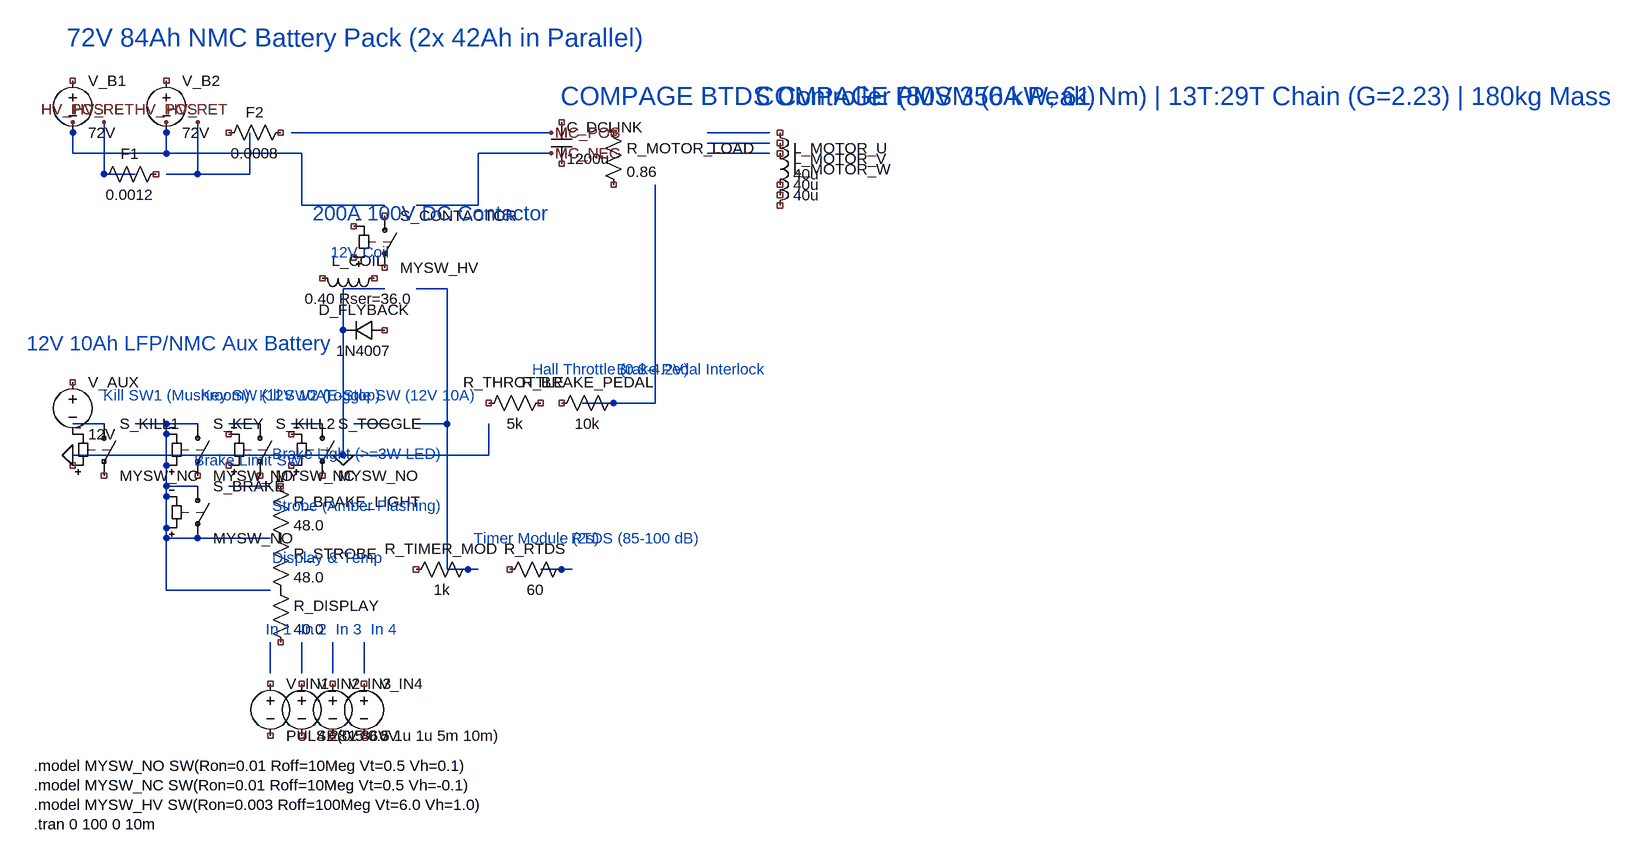
[diagram p0: schematic ev_powertrain.asc]
ev_powertrain.asc, the LTspice schematic file:
Version 4
SHEET 1 2000 1300
WIRE 160 160 160 208
WIRE 160 208 304 208
WIRE 304 208 304 160
WIRE 304 208 512 208
WIRE 208 160 208 240
WIRE 208 240 256 240
WIRE 304 240 352 240
WIRE 352 240 352 160
WIRE 352 240 432 240
WIRE 432 240 432 176
WIRE 496 176 688 176
WIRE 512 208 512 288
WIRE 512 288 640 288
WIRE 688 288 784 288
WIRE 784 288 784 208
WIRE 688 176 896 176
WIRE 784 208 896 208
WIRE 1136 176 1232 176
WIRE 1136 192 1232 192
WIRE 1136 208 1232 208
WIRE 160 624 208 624
WIRE 256 624 304 624
WIRE 304 624 304 720
WIRE 304 624 352 624
WIRE 400 624 448 624
WIRE 496 624 544 624
WIRE 592 624 640 624
WIRE 688 624 736 624
WIRE 736 624 736 416
WIRE 736 416 688 416
WIRE 640 416 576 416
WIRE 576 416 576 672
WIRE 576 672 800 672
WIRE 800 672 800 624
WIRE 160 672 576 672
WIRE 304 720 352 720
WIRE 400 720 464 720
WIRE 304 720 304 800
WIRE 304 800 464 800
WIRE 304 800 304 880
WIRE 304 880 464 880
WIRE 464 960 464 1008
WIRE 512 960 512 1008
WIRE 560 960 560 1008
WIRE 608 960 608 1008
WIRE 736 624 736 848
WIRE 736 848 784 848
WIRE 880 848 928 848
WIRE 1008 592 1056 592
WIRE 1056 592 1056 256
WIRE 944 592 1008 592
FLAG 160 672 0
FLAG 576 672 0
FLAG 208 160 HV_RET
FLAG 352 160 HV_RET
FLAG 896 208 MC_NEG
FLAG 896 176 MC_POS
FLAG 160 160 HV_POS
FLAG 304 160 HV_POS
SYMBOL voltage 160 80 R0
WINDOW 123 0 0 Left 0
WINDOW 39 0 0 Left 0
SYMATTR InstName V_B1
SYMATTR Value 72V
SYMATTR Description 72V 42Ah 3C NMC Pack 1
SYMBOL voltage 304 80 R0
WINDOW 123 0 0 Left 0
WINDOW 39 0 0 Left 0
SYMATTR InstName V_B2
SYMATTR Value 72V
SYMATTR Description 72V 42Ah 3C NMC Pack 2
SYMBOL res 304 224 R90
WINDOW 0 0 56 VBottom 2
WINDOW 3 32 56 VTop 2
SYMATTR InstName F1
SYMATTR Value 0.0012
SYMATTR Description 90A 100V ANL Fuse F1
SYMBOL res 496 160 R90
WINDOW 0 0 56 VBottom 2
WINDOW 3 32 56 VTop 2
SYMATTR InstName F2
SYMATTR Value 0.0008
SYMATTR Description 150A 100V ANL Main Fuse F2
SYMBOL sw 640 288 R0
SYMATTR InstName S_CONTACTOR
SYMATTR Value MYSW_HV
SYMATTR Description 200A 100V DC Contactor Contacts
SYMBOL ind 640 384 R90
WINDOW 0 5 40 VBottom 2
WINDOW 3 32 40 VTop 2
SYMATTR InstName L_COIL
SYMATTR Value 0.40 Rser=36.0
SYMATTR Description 12V Contactor Coil (36 Ohm)
SYMBOL diode 640 464 R90
WINDOW 0 0 32 VBottom 2
WINDOW 3 32 32 VTop 2
SYMATTR InstName D_FLYBACK
SYMATTR Value 1N4007
SYMATTR Description Flyback Protection Diode
SYMBOL voltage 160 544 R0
WINDOW 123 0 0 Left 0
WINDOW 39 0 0 Left 0
SYMATTR InstName V_AUX
SYMATTR Value 12V
SYMATTR Description 12V 10Ah LFP/NMC Auxiliary Battery
SYMBOL sw 208 608 R0
SYMATTR InstName S_KILL1
SYMATTR Value MYSW_NC
SYMATTR Description Kill SW1 (Cockpit Mushroom E-Stop 22.5mm)
SYMBOL sw 352 608 R0
SYMATTR InstName S_KEY
SYMATTR Value MYSW_NO
SYMATTR Description Key SW (Metal Body 12V 10A)
SYMBOL sw 448 608 R0
SYMATTR InstName S_KILL2
SYMATTR Value MYSW_NC
SYMATTR Description Kill SW2 (Push-Pull E-Stop 22mm)
SYMBOL sw 544 608 R0
SYMATTR InstName S_TOGGLE
SYMATTR Value MYSW_NO
SYMATTR Description Toggle SW (12V 10A DPST Covered)
SYMBOL sw 352 704 R0
SYMATTR InstName S_BRAKE
SYMATTR Value MYSW_NO
SYMATTR Description Brake Over-Travel Switch (NC Limit SW 12V 5A)
SYMBOL res 464 704 R0
SYMATTR InstName R_BRAKE_LIGHT
SYMATTR Value 48.0
SYMATTR Description >=3W Red LED Brake Lamp (IP65)
SYMBOL res 464 784 R0
SYMATTR InstName R_STROBE
SYMATTR Value 48.0
SYMATTR Description >=3W Amber Flashing Strobe (IP65)
SYMBOL res 464 864 R0
SYMATTR InstName R_DISPLAY
SYMATTR Value 40.0
SYMATTR Description Digital Dash & Temp Readout (20-150C)
SYMBOL voltage 464 1008 R0
WINDOW 123 0 0 Left 0
WINDOW 39 0 0 Left 0
SYMATTR InstName V_IN1
SYMATTR Value PULSE(0 5 0.5 1u 1u 5m 10m)
SYMATTR Description In 1: Speed Pulse
SYMBOL voltage 512 1008 R0
WINDOW 123 0 0 Left 0
WINDOW 39 0 0 Left 0
SYMATTR InstName V_IN2
SYMATTR Value 4.28V
SYMATTR Description In 2: 72V Battery (84V Scaled)
SYMBOL voltage 560 1008 R0
WINDOW 123 0 0 Left 0
WINDOW 39 0 0 Left 0
SYMATTR InstName V_IN3
SYMATTR Value 1.86V
SYMATTR Description In 3: Motor Temp Sensor
SYMBOL voltage 608 1008 R0
WINDOW 123 0 0 Left 0
WINDOW 39 0 0 Left 0
SYMATTR InstName V_IN4
SYMATTR Value 0V
SYMATTR Description In 4: E-Stop Fault Flag
SYMBOL res 784 832 R90
WINDOW 0 0 56 VBottom 2
WINDOW 3 32 56 VTop 2
SYMATTR InstName R_TIMER_MOD
SYMATTR Value 1k
SYMATTR Description 2.0s One-Shot Timer Module
SYMBOL res 928 832 R90
WINDOW 0 0 56 VBottom 2
WINDOW 3 32 56 VTop 2
SYMATTR InstName R_RTDS
SYMATTR Value 60
SYMATTR Description Ready-To-Drive Sounder (85-100 dB)
SYMBOL res 896 576 R90
WINDOW 0 0 56 VBottom 2
WINDOW 3 32 56 VTop 2
SYMATTR InstName R_THROTTLE
SYMATTR Value 5k
SYMATTR Description Hall Foot Throttle (0.8V to 4.2V)
SYMBOL res 1008 576 R90
WINDOW 0 0 56 VBottom 2
WINDOW 3 32 56 VTop 2
SYMATTR InstName R_BRAKE_PEDAL
SYMATTR Value 10k
SYMATTR Description Brake Plausibility Device (BPD)
SYMBOL cap 896 160 R0
SYMATTR InstName C_DCLINK
SYMATTR Value 1200u
SYMATTR Description COMPAGE Controller DC-Link Cap
SYMBOL res 976 160 R0
SYMATTR InstName R_MOTOR_LOAD
SYMATTR Value 0.86
SYMATTR Description 6 kW COMPAGE PMSM (61 Nm Peak)
SYMBOL ind 1232 160 R0
SYMATTR InstName L_MOTOR_U
SYMATTR Value 40u
SYMATTR Description Motor Phase U
SYMBOL ind 1232 176 R0
SYMATTR InstName L_MOTOR_V
SYMATTR Value 40u
SYMATTR Description Motor Phase V
SYMBOL ind 1232 192 R0
SYMATTR InstName L_MOTOR_W
SYMATTR Value 40u
SYMATTR Description Motor Phase W
TEXT 140 30 Left 4 ; 72V 84Ah NMC Battery Pack (2x 42Ah in Parallel)
TEXT 520 300 Left 3 ; 200A 100V DC Contactor
TEXT 550 360 Left 2 ; 12V Coil
TEXT 80 500 Left 3 ; 12V 10Ah LFP/NMC Aux Battery
TEXT 200 580 Left 2 ; Kill SW1 (Mushroom)
TEXT 350 580 Left 2 ; Key SW (12V 10A)
TEXT 440 580 Left 2 ; Kill SW2 (E-Stop)
TEXT 540 580 Left 2 ; Toggle SW (12V 10A)
TEXT 340 680 Left 2 ; Brake Limit SW
TEXT 460 670 Left 2 ; Brake Light (>=3W LED)
TEXT 460 750 Left 2 ; Strobe (Amber Flashing)
TEXT 460 830 Left 2 ; Display & Temp
TEXT 450 940 Left 2 ; In 1  In 2  In 3  In 4
TEXT 770 800 Left 2 ; Timer Module (2s)
TEXT 920 800 Left 2 ; RTDS (85-100 dB)
TEXT 860 540 Left 2 ; Hall Throttle (0.8-4.2V)
TEXT 990 540 Left 2 ; Brake Pedal Interlock
TEXT 900 120 Left 4 ; COMPAGE BTDS Controller (80V 350A Peak)
TEXT 1200 120 Left 4 ; COMPAGE PMSM (6 kW, 61 Nm) | 13T:29T Chain (G=2.23) | 180kg Mass
TEXT 100 1150 Left 2 !.model MYSW_NO SW(Ron=0.01 Roff=10Meg Vt=0.5 Vh=0.1)
TEXT 100 1180 Left 2 !.model MYSW_NC SW(Ron=0.01 Roff=10Meg Vt=0.5 Vh=-0.1)
TEXT 100 1210 Left 2 !.model MYSW_HV SW(Ron=0.003 Roff=100Meg Vt=6.0 Vh=1.0)
TEXT 100 1240 Left 2 !.tran 0 100 0 10m

The netlist it stands for:
* ev_powertrain.asc
V_B1 NC_01 HV_POS 72V
V_B2 NC_02 HV_POS 72V
R§F1 NC_03 HV_RET 0.0012
R§F2 NC_04 NC_05 0.0008
S_CONTACTOR NC_06 NC_07 NC_08 NC_09 MYSW_HV
L_COIL NC_10 NC_11 0.40 Rser=36.0
D_FLYBACK NC_12 0 1N4007
V_AUX NC_13 P001 12V
* S_KILL1: MYSW_NC (symbol sw not certain, pin order unknown); nets seen at it: N004, P001
S_KEY N005 NC_16 N005 N005 MYSW_NO
* S_KILL2: MYSW_NC (symbol sw not certain, pin order unknown); nets seen at it: N006
* S_TOGGLE: MYSW_NO (symbol sw not certain, pin order unknown); nets seen at it: N007
S_BRAKE N005 N005 N005 N005 MYSW_NO
R_BRAKE_LIGHT NC_23 P002 48.0
R_STROBE P002 P003 48.0
R_DISPLAY P003 NC_24 40.0
V_IN1 NC_25 NC_26 PULSE(0 5 0.5 1u 1u 5m 10m)
V_IN2 NC_27 NC_28 4.28V
V_IN3 NC_29 NC_30 1.86V
V_IN4 NC_31 NC_32 0V
R_TIMER_MOD N009 NC_33 1k
R_RTDS N015 NC_34 60
R_THROTTLE NC_35 NC_36 5k
R_BRAKE_PEDAL N016 NC_37 10k
C_DCLINK NC_38 NC_39 1200u
R_MOTOR_LOAD NC_40 NC_41 0.86
L_MOTOR_U NC_42 NC_43 40u
L_MOTOR_V NC_44 NC_45 40u
L_MOTOR_W NC_46 NC_47 40u
.model D D
.lib standard.dio
*  72V 84Ah NMC Battery Pack (2x 42Ah in Parallel)
*  200A 100V DC Contactor
*  12V Coil
*  12V 10Ah LFP/NMC Aux Battery
*  Kill SW1 (Mushroom)
*  Key SW (12V 10A)
*  Kill SW2 (E-Stop)
*  Toggle SW (12V 10A)
*  Brake Limit SW
*  Brake Light (>=3W LED)
*  Strobe (Amber Flashing)
*  Display & Temp
*  In 1  In 2  In 3  In 4
*  Timer Module (2s)
*  RTDS (85-100 dB)
*  Hall Throttle (0.8-4.2V)
*  Brake Pedal Interlock
*  COMPAGE BTDS Controller (80V 350A Peak)
*  COMPAGE PMSM (6 kW, 61 Nm) | 13T:29T Chain (G=2.23) | 180kg Mass
.model MYSW_NO SW(Ron=0.01 Roff=10Meg Vt=0.5 Vh=0.1)
.model MYSW_NC SW(Ron=0.01 Roff=10Meg Vt=0.5 Vh=-0.1)
.model MYSW_HV SW(Ron=0.003 Roff=100Meg Vt=6.0 Vh=1.0)
.tran 0 100 0 10m
.backanno
.end